# Altium project DishMachine.PrjPcb
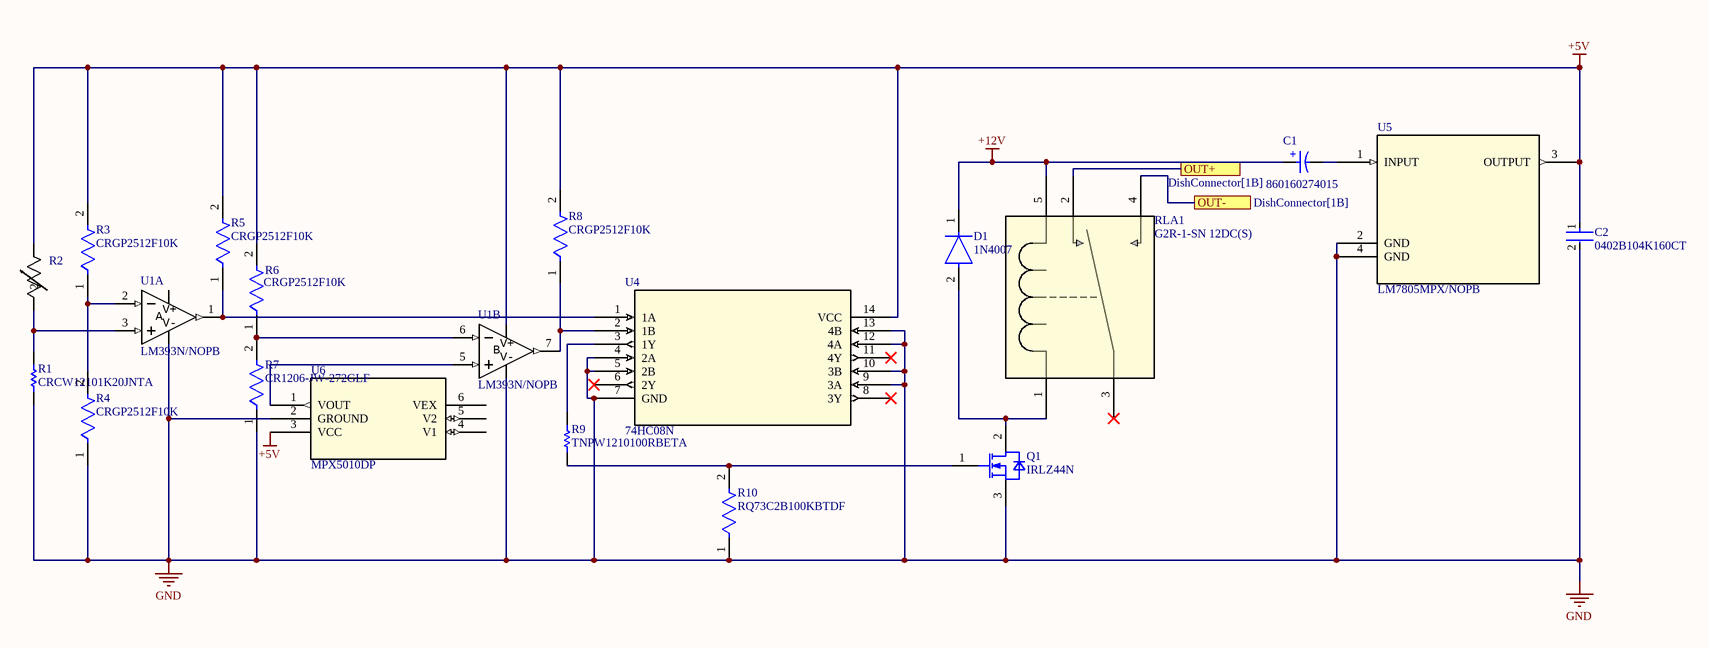
[diagram p0: DishMachine.SchDoc]
2 sheets, 21 parts. Net scope: flat (ports and power ports of the same name join across sheets).
Board file: DishMachine.PcbDoc
Sheets:
  DishMachine.SchDoc
  DishConnector.SchDoc

## Sheet DishMachine.SchDoc
size B; SheetNumber: 1; SheetTotal: 2

### Parts
C1  860160274015  [WCAP-ATLL_D8H11.5]
C2  0402B104K160CT  [FP-0402B104K160CT-IPC_C]
D1  1N4007  [FP-1N4007-MFG]
Q1  IRLZ44N  [IFX-PG-TO220-3-904-1]
R1  CRCW12101K20JNTA  [RESC3225X60X45NL20T20]
R2  NTCLE100E3103JB0  [THER_RADIAL_NTCLE100E3_VIS]  (value not drawn)
R3  CRGP2512F10K  [FP-CRGP2512-IPC_C]
R4  CRGP2512F10K  [FP-CRGP2512-IPC_C]
R5  CRGP2512F10K  [FP-CRGP2512-IPC_C]
R6  CRGP2512F10K  [FP-CRGP2512-IPC_C]
R7  CR1206-JW-272GLF  [FP-CR1206-IPC_B]
R8  CRGP2512F10K  [FP-CRGP2512-IPC_C]
R9  TNPW1210100RBETA  [RESC3225X75X50NL15T25]
R10  RQ73C2B100KBTDF  [FP-RQ732B-IPC_C]
RLA1  G2R-1-SN 12DC(S)  [RELAY_G2R-1-SN_OMR]
U1  LM393N/NOPB  [N08E]  (parts A,B of 3)
U4  74HC08N  [SOT27-1_NXP]
U5  LM7805MPX/NOPB  [DCY4_TEX]
U6  MPX5010DP  [MPX5010DP_MOT]

### Ports
OUT+ (see DishConnector[1B]), OUT- (see DishConnector[1B])

### Nets
+5V: C2.1 R2.1 R3.2 R5.2 R6.2 R8.2 U4.14(VCC) U5.3(OUTPUT) U6.3(VCC)
+12V: C1.1(P) D1.1(C) RLA1.5
GND: C2.2 Q1.3(SOURCE) R1.1 R4.1 R7.1 R10.1 U4.4(2A) U4.5(2B) U4.7(GND) U4.9(3A) U4.10(3B) U4.12(4A) U4.13(4B) U5.2(GND) U5.4(GND) U6.2(GROUND)
NetC1_2: C1.2(N) U5.1(INPUT)
NetD1_2: D1.2(A) Q1.2(DRAIN) RLA1.1
NetP1_1: RLA1.4 ; port OUT-
NetP1_2: RLA1.2 ; port OUT+
NetQ1_1: Q1.1(GATE) R9.1 R10.2
NetR1_2: R1.2 R2.2 U1.3(IN+)
NetR3_1: R3.1 R4.2 U1.2(IN-)
NetR5_1: R5.1 U1.1(OUT) U4.1(1A)
NetR6_1: R6.1 R7.2 U1.6(IN-)
NetR8_1: R8.1 U1.7(OUT) U4.2(1B)
NetR9_2: R9.2 U4.3(1Y)
NetU1_5: U1.5(IN+) U6.1(VOUT)

Not connected (* = marked no-connect by the designer): RLA1 3(2)*; U4 6(2Y)* 8(3Y)* 11(4Y)*; U6 4(V1) 5(V2) 6(VEX)

### Notes on the sheet
- (in symbol CMP-03913-54007388-2) +
- (in symbol LM393NNOPB, part A) V+; A; V-
- (in symbol LM393NNOPB, part B) V+; B; V-

### Library data of the parts
C1 = CMP-03913-54007388-2: Aluminium Electrolytic Capacitor-Leaded Rohs Compliant: Yes; Leakage Current: 27µA; Polarity: Polar; Voltage Rating: 10V; Ripple Current: 420mA; Pitch: 3.5mm; Impedance: 530mΩ; Life (Hours): 7000hours; Capacitance: 270µF; Tolerance: 20%; Mount: Through Hole; Max Operating Temperature: 105°C; Length: 11.5mm; Lead Pitch: 3.5052mm; Min Operating Temperature: -55°C; Height - Seated (Max): 13.0048mm; Case/Package: Radial; Diameter: 8mm; Packaging: Tape & Box (TB); RoHS: Compliant
C2 = CMP-45632-000002-1: CAP CER 0.1UF 16V X7R 0402; Capacitance: 100nF; Tolerance: 10%; Case Code (Imperial): 0402; Length: 1mm; Radiation Hardening: No; Case Code (Metric): 1005; Max Operating Temperature: 125°C; Voltage Rating: 16V; Voltage Rating (DC): 16V; Dielectric: X7R; RoHS Compliant: Yes; Packaging: Tape and Reel; Lead Free: Lead Free; Depth: 0.5mm; Case/Package: 0402; Min Operating Temperature: -55°C; Series: -
D1 = CMP-123542-000001-1: Rectifier diode 1000 V 1 A DO-41, ,; Manufacturer: Diotec; Max Surge Forward Current: 27A; Forward Current: 1A; Max Junction Temp: +175°C; Reverse Voltage: 1000V; Value: 15pF; Peak Reverse Current: 5uA; Category: Diode; Temperature Range Low: -50°C; Automotive: No; Temperature: -50°C to +175°C; Lead Free: Yes; ComponentLink2Description: Datasheet; Max Repetitive Reverse Voltage: 1000V; ComponentLink2URL: https://datasheet.octopart.com/1N4007-Diotec-datasheet-62346875.pdf; Manufacturer Part Number: 1N4007; Device Class L3: Rectifier Diodes; Height: 2.8mm; Octopart: https://octopart.com/1n4007-diotec-4040411; Package: 1N4007; Temperature Range High: +175°C; Device Class L1: Discrete Semiconductors; Device Class L2: Diodes; RoHS: TRUE; Capacitance: 15pF; Ipc Land Pattern Name: DIOAD888W100L520D280
Q1 = IRLZ44N: OptiMOS 3 Power-Transistor, VDS 100V; Manufacturer: Infineon Technologies; Manufacturer Order Number: IRLZ44N; PackageReference: PG-TO220-3-904
R1 = CMP-2005-00718-1: Manufacturer: Vishay Dale; Part Number: CRCW12101K20JNTA
R2 = NTCLE100E3103JB0: NTC CU 0.6 LD CODED 10K 5% BULK E3; Manufacturer_Name: Vishay; Copyright: Copyright (C) 2026 Ultra Librarian. All rights reserved.; Manufacturer_Part_Number: NTCLE100E3103JB0; Datasheet: https://www.vishay.com/doc?29049; Digi-Key_Part_Number_1: BC2301-ND
R3-R6 R8 = CMP-03211-007941-1: CRGP 2512 10K 1%; Manufacturer: TE; Voltage Rating: 500V; Tolerance: 0.01; Value: 10KΩ; Temperature Coefficient: ±100ppm/°C; Power Rating: 2W; ComponentLink2Description: Datasheet; Series: CRGP; Temperature: -55°C to +155°C; ComponentLink2URL: https://www.mouser.ca/datasheet/2/418/NG_DS_9-1773463-9_A-1358566.pdf; Device Class L3: Chip SMD Resistors; Temperature Range High: +155°C; Ipc Land Pattern Name: RESC635320X55; Manufacturer Part Number: CRGP2512F10K; Height: 0.65mm; RoHS: TRUE; Ambient Temperature Range High: +70°C; Lead Free: Yes; Composition: Thick Film; Device Class L1: Passive Components; Automotive: No; Octopart: https://octopart.com/crgp2512f10k-te+connectivity-91019026; Digikey Description: CRGP 2512 10K 1%; Package: CRGP2512; Temperature Range Low: -55°C; Resistance: 10KΩ; Category: Res; Device Class L2: Resistors
R7 = CMP-07231-005324-1: Thick Film Chip Resistors 1206 2.7kΩ 0.25W 5% 200ppm/°C; Voltage Rating: 200V; Resistance: 2.7kR; Power Rating: 250mW; Radiation Hardening: No; Composition: Thick Film; Temperature Coefficient: 200ppm/°C; Number of Terminations: 2; Termination: SMD/SMT; Depth: 1.6mm; Packaging: Tape and Reel; Height: 0.03inch; Mount: Surface Mount; Features: Moisture Resistant; Tolerance: 5%; Package Quantity: 10000; Contact Plating: Tin; Thickness: 610um; Case Code (Imperial): 1206; Max Power Dissipation: 250mW; Min Operating Temperature: -55°C; Military Standard: Not; Max Operating Temperature: 155°C; Case Code (Metric): 3216; Length: 3.2mm; Case/Package: 1206; Width: 1.6mm
R9 = CMP-2005-00866-1: Manufacturer: Vishay Dale; Part Number: TNPW1210100RBETA
R10 = CMP-03211-010469-1: RQ732B 1206 100KΩ 0.4W 10ppm/°C 0.1% 200V; Manufacturer: TE; Automotive Grade: Grade 0; Package: RQ732B; Device Class L2: Resistors; Device Class L1: Passive Components; Tolerance: 0.1%; Value: 100KΩ; Automotive: Yes; Lead Free: Yes; ComponentLink2Description: Datasheet; Temperature Range Low: -55°C; Manufacturer Part Number: RQ73C2B100KBTDF; Temperature Range High: +155°C; Temperature: -55°C to +155°C; Composition: Thin Film; Temperature Coefficient: 10ppm/°C; Ipc Land Pattern Name: RESC310160X60; Voltage Rating: 200V; Power Rating: 0.4W; Octopart: https://octopart.com/rq73c2b100kbtdf-te+connectivity-99292337; Device Class L3: Chip SMD Resistors; Resistance: 100KΩ; RoHS: TRUE; Category: Res; Height: 0.75mm; ComponentLink2URL: https://www.te.com/commerce/DocumentDelivery/DDEController?Action=showdoc&DocId=Data+Sheet%7F1773270-2%7FA%7Fpdf%7FEnglish%7FENG_DS_1773270-2_A.pdf%7F9-2176388-1377; Series: RQ73
RLA1 = G2R-1-SN 12DCS: No Description Available; Manufacturer_Name: Omron; Copyright: Copyright (C) 2026 Ultra Librarian. All rights reserved.; Manufacturer_Part_Number: G2R-1-SN 12DC(S); RefDes: RefDes; Type: Type
U1 = LM393NNOPB: Low Power Low Offset Voltage Dual Comparator 8-PDIP 0 to 70; Manufacturer_Name: Texas Instruments; PartNumber: LM393N; Manufacturer: NationalSemiconductor; Characteristics: LM393NLowPowerLowOffsetVoltageDualComparator; CompType: ComparatorIC; TaMin_C: 00; TaMax_C: 700; ComponentLink1DescBC: LM393Datasheet; ComponentLink2DescA4: LM393WebPage; ComponentLink3DescAC: N08EPackageWebPage; Copyright: Copyright (C) 2025 Ultra Librarian. All rights reserved.; Manufacturer_Part_Number: LM393N/NOPB; SymbolVersion: 2008-07-09; PackageDescription: 8LeadPlasticDIP; PackageReference: N08E_L; RoHS: O; ComponentLink1URL: http//wwwnationalcom/ds/LM/LM393pdf; ComponentLink2URL: http//wwwnationalcom/pf/LM/LM393html; ComponentLink3URL: http//wwwnationalcom/packaging/folders/n08ehtml; Version: B1608; LatestRevisionDate: 2009-03-16; LatestRevisionNote: MassUpdate; Publisher: NationalSemiconductor; Published: 2009-03-16
U4 = 74HC08N: Description; Manufacturer_Name: NXP; Copyright: Copyright (C) 2026 Ultra Librarian. All rights reserved.; Manufacturer_Part_Number: 74HC08N; RefDes: RefDes; Type: Type
U5 = LM7805MPXNOPB: 1.5-A, 30-V, linear voltage regulator 4-SOT-223 0 to 125; Manufacturer_Name: Texas Instruments; Copyright: Copyright (C) 2025 Ultra Librarian. All rights reserved.; Manufacturer_Part_Number: LM7805MPX/NOPB; RefDes: RefDes; Type: Type
U6 = MPX5010DP: Description; Manufacturer_Name: Motorola; Copyright: Copyright (C) 2026 Ultra Librarian. All rights reserved.; Manufacturer_Part_Number: MPX5010DP; RefDes: RefDes; Type: Type

## Sheet DishConnector.SchDoc
size A; SheetNumber: 2; SheetTotal: 2
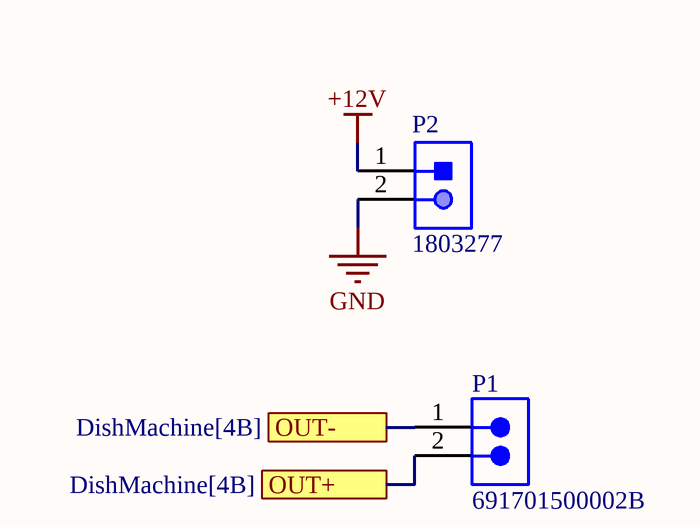
[diagram p1: DishConnector.SchDoc]

### Parts
P1  691701500002B  [691701500002B]
P2  1803277  [PHOE-1803277_V]

### Ports
OUT+ (see DishMachine[4B]), OUT- (see DishMachine[4B])

### Nets
+12V: P2.1
GND: P2.2
NetP1_1: P1.1 ; port OUT-
NetP1_2: P1.2 ; port OUT+

### Library data of the parts
P1 = CMP-1502-02318-3: Terminal Block, 5.08MM, Open Vertical Pcb Header, Thr Type, 2 Pins; Gender: Male; Number of Contacts: 2; Current Rating: 10A; Voltage Rating: 300V; Mount: Through Hole; Max Operating Temperature: 105°C; Contact Gender: Male; REACH SVHC: Unknown; Color: Black; Number of Pins: 2; RoHS: Compliant; Contact Material: Brass; Length: 9.76mm; Min Operating Temperature: -40°C; Housing Material: Polymer; Pitch: 5.08mm; Connector Type: Terminal Block; Contact Plating: Tin; Lead Pitch: 5.08mm; Termination: PCB
P2 = CMP-002-00014-2: Male Header, Pitch 3.81 mm, 1 x 2 Position, Height 7.25 mm, Tail Length 3.4 mm, RoHS, Bulk; Manufacturer: Phoenix Contact; Voltage Rating: 160V; Current Rating: 8A; Rows: 1; Mounting Technology: TH; Contact Plating: Tin; Case/Package: 1803277; Gender: Male; Diameter: 7.25mm; Datasheet Version: Feb-14; Colour: Green; Pins: 2; Lead Pitch: 0.15inch; Connector Type: Header; Package Quantity: 50; Max Current Rating: 8A; Manufacturer URL: http://www.phoenixcontact.com/; Packaging: Bulk; RoHS Compliant: True; Datasheet URL: https://datasheet.ciiva.com/16096/1803277-16096845.pdf; Package Reference: 1803277; Package Description: Male Header, Pitch 3.81 mm, 1 x 2 Position, Height 7.25 mm, Tail Length 3.4 mm

## Nets that join several sheets
+12V: DishMachine (C1.1 D1.1 RLA1.5), DishConnector (P2.1)
GND: DishMachine (16 pins), DishConnector (P2.2)
NetP1_1: DishMachine (RLA1.4), DishConnector (P1.1)
NetP1_2: DishMachine (RLA1.2), DishConnector (P1.2)